# Altium schematic sheet Main.SchDoc
size A; SheetNumber: 1; SheetTotal: 7
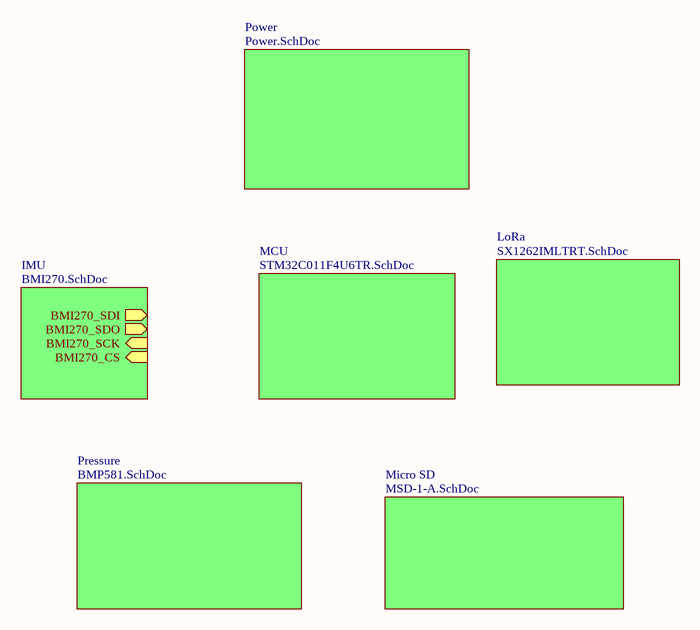
[diagram p0: Main.SchDoc]

## Sub-sheets
IMU = BMI270.SchDoc: BMI270_SDI (out), BMI270_SDO (out), BMI270_SCK (in), BMI270_CS (in)
LoRa = SX1262IMLTRT.SchDoc: no entries
MCU = STM32C011F4U6TR.SchDoc: no entries
Micro SD = MSD-1-A.SchDoc: no entries
Power = Power.SchDoc: no entries
Pressure = BMP581.SchDoc: no entries